# Altium project Custom_Keyboard.PrjPcb (part 3 of 3)
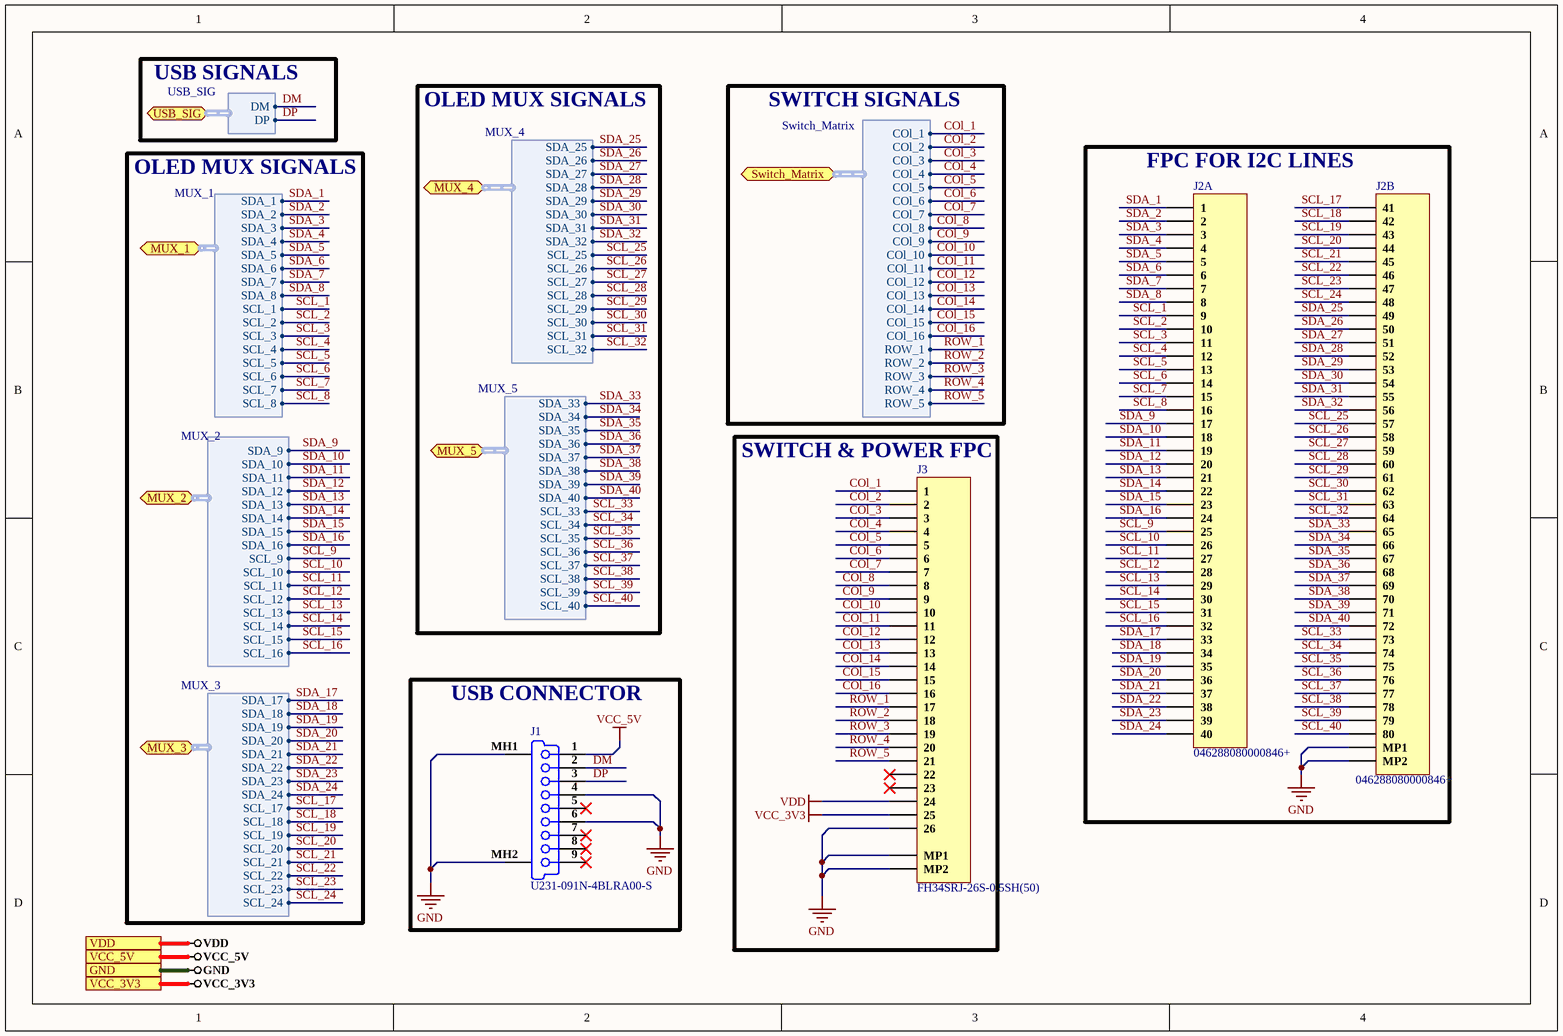
[diagram p10: Connector_Sheet.SchDoc]

## Nets that join several sheets
GND: Controller_Section_1 (29 pins), Mux_Sheet_1 (9 pins), Mux_Sheet_2 (6 pins), Power_Section (14 pins), Connector_Sheet (9 pins)
VCC_3V3: Controller_Section_1 (22 pins), Controller_Section_2 (16 pins), Mux_Sheet_1 (21 pins), Mux_Sheet_2 (14 pins), RPull_Section (80 pins), Power_Section (C32.1 C33.1 U1.1), Connector_Sheet (J3.25)
VCC_5V: Power_Section (10 pins), Connector_Sheet (J1.1)
VDD: Power_Section (Q1.3), Connector_Sheet (J3.24)
COl_1: Controller_Section_2 (R6.1 U2.81), Connector_Sheet (J3.1)
COl_2: Controller_Section_2 (R37.1 U2.82), Connector_Sheet (J3.2)
COl_3: Controller_Section_2 (R38.1 U2.83), Connector_Sheet (J3.3)
COl_4: Controller_Section_2 (R39.1 U2.84), Connector_Sheet (J3.4)
COl_5: Controller_Section_2 (R40.1 U2.85), Connector_Sheet (J3.5)
COl_6: Controller_Section_2 (R41.1 U2.25), Connector_Sheet (J3.6)
COl_7: Controller_Section_2 (R42.1 U2.87), Connector_Sheet (J3.7)
COl_8: Controller_Section_2 (R110.1 U2.24), Connector_Sheet (J3.8)
COl_9: Controller_Section_2 (R111.1 U2.16), Connector_Sheet (J3.9)
COl_10: Controller_Section_2 (R112.1 U2.17), Connector_Sheet (J3.10)
COl_11: Controller_Section_2 (R113.1 U2.18), Connector_Sheet (J3.11)
COl_12: Controller_Section_2 (R114.1 U2.33), Connector_Sheet (J3.12)
COl_13: Controller_Section_2 (R115.1 U2.34), Connector_Sheet (J3.13)
COl_14: Controller_Section_2 (R116.1 U2.63), Connector_Sheet (J3.14)
COl_15: Controller_Section_2 (R117.1 U2.64), Connector_Sheet (J3.15)
COl_16: Controller_Section_2 (R118.1 U2.65), Connector_Sheet (J3.16)
DM: Controller_Section_2 (U2.70), Connector_Sheet (J1.2)
DP: Controller_Section_2 (U2.71), Connector_Sheet (J1.3)
I2C1_SCL: Controller_Section_2 (U2.92), Mux_Sheet_1 (R11.2 U4.22)
I2C1_SDA: Controller_Section_2 (U2.93), Mux_Sheet_1 (R9.2 U4.23)
I2C2_SCL: Controller_Section_2 (U2.47), Mux_Sheet_1 (R8.2 R20.2 U3.22 U5.22)
I2C2_SDA: Controller_Section_2 (U2.48), Mux_Sheet_1 (R7.2 R19.2 U3.23 U5.23)
I2C3_SCL: Controller_Section_2 (U2.67), Mux_Sheet_2 (R27.2 R28.2 U6.22 U7.22)
I2C3_SDA: Controller_Section_2 (U2.66), Mux_Sheet_2 (R25.2 R26.2 U6.23 U7.23)
MUX_1.SCL_1: Mux_Sheet_1 (U4.5), RPull_Section (R44.1), Connector_Sheet (J2.9)
MUX_1.SCL_2: Mux_Sheet_1 (U4.7), RPull_Section (R46.1), Connector_Sheet (J2.10)
MUX_1.SCL_3: Mux_Sheet_1 (U4.9), RPull_Section (R48.1), Connector_Sheet (J2.11)
MUX_1.SCL_4: Mux_Sheet_1 (U4.11), RPull_Section (R50.1), Connector_Sheet (J2.12)
MUX_1.SCL_5: Mux_Sheet_1 (U4.14), RPull_Section (R52.1), Connector_Sheet (J2.13)
MUX_1.SCL_6: Mux_Sheet_1 (U4.16), RPull_Section (R54.1), Connector_Sheet (J2.14)
MUX_1.SCL_7: Mux_Sheet_1 (U4.18), RPull_Section (R56.1), Connector_Sheet (J2.15)
MUX_1.SCL_8: Mux_Sheet_1 (U4.20), RPull_Section (R58.1), Connector_Sheet (J2.16)
MUX_1.SDA_1: Mux_Sheet_1 (U4.4), RPull_Section (R43.1), Connector_Sheet (J2.1)
MUX_1.SDA_2: Mux_Sheet_1 (U4.6), RPull_Section (R45.1), Connector_Sheet (J2.2)
MUX_1.SDA_3: Mux_Sheet_1 (U4.8), RPull_Section (R47.1), Connector_Sheet (J2.3)
MUX_1.SDA_4: Mux_Sheet_1 (U4.10), RPull_Section (R49.1), Connector_Sheet (J2.4)
MUX_1.SDA_5: Mux_Sheet_1 (U4.13), RPull_Section (R51.1), Connector_Sheet (J2.5)
MUX_1.SDA_6: Mux_Sheet_1 (U4.15), RPull_Section (R53.1), Connector_Sheet (J2.6)
MUX_1.SDA_7: Mux_Sheet_1 (U4.17), RPull_Section (R55.1), Connector_Sheet (J2.7)
MUX_1.SDA_8: Mux_Sheet_1 (U4.19), RPull_Section (R57.1), Connector_Sheet (J2.8)
MUX_2.SCL_9: Mux_Sheet_1 (U3.5), RPull_Section (R60.1), Connector_Sheet (J2.25)
MUX_2.SCL_10: Mux_Sheet_1 (U3.7), RPull_Section (R62.1), Connector_Sheet (J2.26)
MUX_2.SCL_11: Mux_Sheet_1 (U3.9), RPull_Section (R64.1), Connector_Sheet (J2.27)
MUX_2.SCL_12: Mux_Sheet_1 (U3.11), RPull_Section (R66.1), Connector_Sheet (J2.28)
MUX_2.SCL_13: Mux_Sheet_1 (U3.14), RPull_Section (R68.1), Connector_Sheet (J2.29)
MUX_2.SCL_14: Mux_Sheet_1 (U3.16), RPull_Section (R70.1), Connector_Sheet (J2.30)
MUX_2.SCL_15: Mux_Sheet_1 (U3.18), RPull_Section (R72.1), Connector_Sheet (J2.31)
MUX_2.SCL_16: Mux_Sheet_1 (U3.20), RPull_Section (R74.1), Connector_Sheet (J2.32)
MUX_2.SDA_9: Mux_Sheet_1 (U3.4), RPull_Section (R59.1), Connector_Sheet (J2.17)
MUX_2.SDA_10: Mux_Sheet_1 (U3.6), RPull_Section (R61.1), Connector_Sheet (J2.18)
MUX_2.SDA_11: Mux_Sheet_1 (U3.8), RPull_Section (R63.1), Connector_Sheet (J2.19)
MUX_2.SDA_12: Mux_Sheet_1 (U3.10), RPull_Section (R65.1), Connector_Sheet (J2.20)
MUX_2.SDA_13: Mux_Sheet_1 (U3.13), RPull_Section (R67.1), Connector_Sheet (J2.21)
MUX_2.SDA_14: Mux_Sheet_1 (U3.15), RPull_Section (R69.1), Connector_Sheet (J2.22)
MUX_2.SDA_15: Mux_Sheet_1 (U3.17), RPull_Section (R71.1), Connector_Sheet (J2.23)
MUX_2.SDA_16: Mux_Sheet_1 (U3.19), RPull_Section (R73.1), Connector_Sheet (J2.24)
MUX_3.SCL_17: Mux_Sheet_1 (U5.5), RPull_Section (R76.1), Connector_Sheet (J2.41)
MUX_3.SCL_18: Mux_Sheet_1 (U5.7), RPull_Section (R78.1), Connector_Sheet (J2.42)
MUX_3.SCL_19: Mux_Sheet_1 (U5.9), RPull_Section (R80.1), Connector_Sheet (J2.43)
MUX_3.SCL_20: Mux_Sheet_1 (U5.11), RPull_Section (R82.1), Connector_Sheet (J2.44)
MUX_3.SCL_21: Mux_Sheet_1 (U5.14), RPull_Section (R84.1), Connector_Sheet (J2.45)
MUX_3.SCL_22: Mux_Sheet_1 (U5.16), RPull_Section (R86.1), Connector_Sheet (J2.46)
MUX_3.SCL_23: Mux_Sheet_1 (U5.18), RPull_Section (R88.1), Connector_Sheet (J2.47)
MUX_3.SCL_24: Mux_Sheet_1 (U5.20), RPull_Section (R90.1), Connector_Sheet (J2.48)
MUX_3.SDA_17: Mux_Sheet_1 (U5.4), RPull_Section (R75.1), Connector_Sheet (J2.33)
MUX_3.SDA_18: Mux_Sheet_1 (U5.6), RPull_Section (R77.1), Connector_Sheet (J2.34)
MUX_3.SDA_19: Mux_Sheet_1 (U5.8), RPull_Section (R79.1), Connector_Sheet (J2.35)
MUX_3.SDA_20: Mux_Sheet_1 (U5.10), RPull_Section (R81.1), Connector_Sheet (J2.36)
MUX_3.SDA_21: Mux_Sheet_1 (U5.13), RPull_Section (R83.1), Connector_Sheet (J2.37)
MUX_3.SDA_22: Mux_Sheet_1 (U5.15), RPull_Section (R85.1), Connector_Sheet (J2.38)
MUX_3.SDA_23: Mux_Sheet_1 (U5.17), RPull_Section (R87.1), Connector_Sheet (J2.39)
MUX_3.SDA_24: Mux_Sheet_1 (U5.19), RPull_Section (R89.1), Connector_Sheet (J2.40)
MUX_4.SCL_25: Mux_Sheet_2 (U6.5), RPull_Section (R92.1), Connector_Sheet (J2.57)
MUX_4.SCL_26: Mux_Sheet_2 (U6.7), RPull_Section (R94.1), Connector_Sheet (J2.58)
MUX_4.SCL_27: Mux_Sheet_2 (U6.9), RPull_Section (R96.1), Connector_Sheet (J2.59)
MUX_4.SCL_28: Mux_Sheet_2 (U6.11), RPull_Section (R98.1), Connector_Sheet (J2.60)
MUX_4.SCL_29: Mux_Sheet_2 (U6.14), RPull_Section (R100.1), Connector_Sheet (J2.61)
MUX_4.SCL_30: Mux_Sheet_2 (U6.16), RPull_Section (R102.1), Connector_Sheet (J2.62)
MUX_4.SCL_31: Mux_Sheet_2 (U6.18), RPull_Section (R104.1), Connector_Sheet (J2.63)
MUX_4.SCL_32: Mux_Sheet_2 (U6.20), RPull_Section (R106.1), Connector_Sheet (J2.64)
MUX_4.SDA_25: Mux_Sheet_2 (U6.4), RPull_Section (R91.1), Connector_Sheet (J2.49)
MUX_4.SDA_26: Mux_Sheet_2 (U6.6), RPull_Section (R93.1), Connector_Sheet (J2.50)
MUX_4.SDA_27: Mux_Sheet_2 (U6.8), RPull_Section (R95.1), Connector_Sheet (J2.51)
MUX_4.SDA_28: Mux_Sheet_2 (U6.10), RPull_Section (R97.1), Connector_Sheet (J2.52)
MUX_4.SDA_29: Mux_Sheet_2 (U6.13), RPull_Section (R99.1), Connector_Sheet (J2.53)
MUX_4.SDA_30: Mux_Sheet_2 (U6.15), RPull_Section (R101.1), Connector_Sheet (J2.54)
MUX_4.SDA_31: Mux_Sheet_2 (U6.17), RPull_Section (R103.1), Connector_Sheet (J2.55)
MUX_4.SDA_32: Mux_Sheet_2 (U6.19), RPull_Section (R105.1), Connector_Sheet (J2.56)
MUX_5.SCL_33: Mux_Sheet_2 (U7.5), RPull_Section (R108.1), Connector_Sheet (J2.73)
MUX_5.SCL_34: Mux_Sheet_2 (U7.7), RPull_Section (R120.1), Connector_Sheet (J2.74)
MUX_5.SCL_35: Mux_Sheet_2 (U7.9), RPull_Section (R122.1), Connector_Sheet (J2.75)
MUX_5.SCL_36: Mux_Sheet_2 (U7.11), RPull_Section (R124.1), Connector_Sheet (J2.76)
MUX_5.SCL_37: Mux_Sheet_2 (U7.14), RPull_Section (R126.1), Connector_Sheet (J2.77)
MUX_5.SCL_38: Mux_Sheet_2 (U7.16), RPull_Section (R128.1), Connector_Sheet (J2.78)
MUX_5.SCL_39: Mux_Sheet_2 (U7.18), RPull_Section (R130.1), Connector_Sheet (J2.79)
MUX_5.SCL_40: Mux_Sheet_2 (U7.20), RPull_Section (R132.1), Connector_Sheet (J2.80)
MUX_5.SDA_33: Mux_Sheet_2 (U7.4), RPull_Section (R107.1), Connector_Sheet (J2.65)
MUX_5.SDA_34: Mux_Sheet_2 (U7.6), RPull_Section (R109.1), Connector_Sheet (J2.66)
MUX_5.SDA_35: Mux_Sheet_2 (U7.8), RPull_Section (R121.1), Connector_Sheet (J2.67)
MUX_5.SDA_36: Mux_Sheet_2 (U7.10), RPull_Section (R123.1), Connector_Sheet (J2.68)
MUX_5.SDA_37: Mux_Sheet_2 (U7.13), RPull_Section (R125.1), Connector_Sheet (J2.69)
MUX_5.SDA_38: Mux_Sheet_2 (U7.15), RPull_Section (R127.1), Connector_Sheet (J2.70)
MUX_5.SDA_39: Mux_Sheet_2 (U7.17), RPull_Section (R129.1), Connector_Sheet (J2.71)
MUX_5.SDA_40: Mux_Sheet_2 (U7.19), RPull_Section (R131.1), Connector_Sheet (J2.72)
OLED_IO: Controller_Section_2 (U2.88), Power_Section (Q2.1 R5.2)
ROW_1: Controller_Section_2 (U2.35), Connector_Sheet (J3.17)
ROW_2: Controller_Section_2 (U2.36), Connector_Sheet (J3.18)
ROW_3: Controller_Section_2 (U2.89), Connector_Sheet (J3.19)
ROW_4: Controller_Section_2 (U2.90), Connector_Sheet (J3.20)
ROW_5: Controller_Section_2 (U2.91), Connector_Sheet (J3.21)